# Altium project STM32F411CEU6TR.PrjPcb
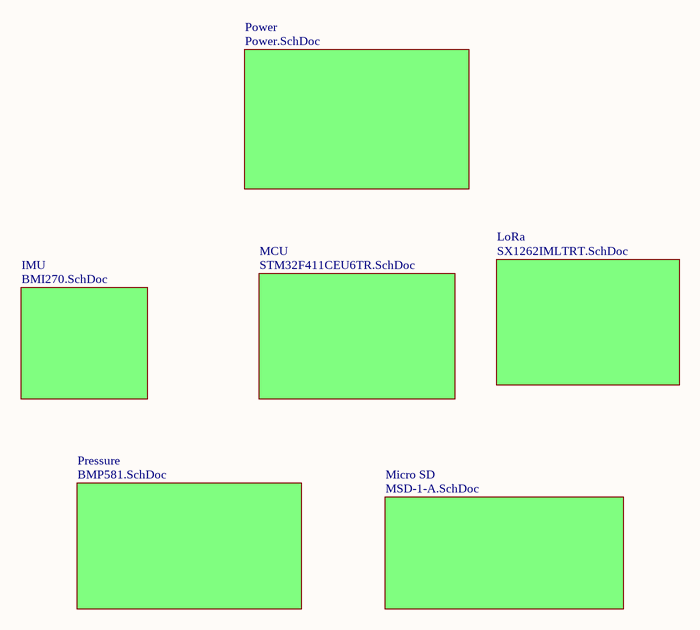
[diagram p0: Main.SchDoc]
7 sheets, 4 parts. Net scope: global (net labels, ports and power ports of the same name join across sheets).
Sheets:
  Main.SchDoc
    MCU = STM32F411CEU6TR.SchDoc
    Pressure = BMP581.SchDoc
    Micro SD = MSD-1-A.SchDoc
    IMU = BMI270.SchDoc
    LoRa = SX1262IMLTRT.SchDoc
    Power = Power.SchDoc

## Sheet Main.SchDoc
size A; SheetNumber: 1; SheetTotal: 7

### Sub-sheets
IMU = BMI270.SchDoc: no entries
LoRa = SX1262IMLTRT.SchDoc: no entries
MCU = STM32F411CEU6TR.SchDoc: no entries
Micro SD = MSD-1-A.SchDoc: no entries
Power = Power.SchDoc: no entries
Pressure = BMP581.SchDoc: no entries

## Sheet STM32F411CEU6TR.SchDoc
size A; SheetNumber: 3; SheetTotal: 7
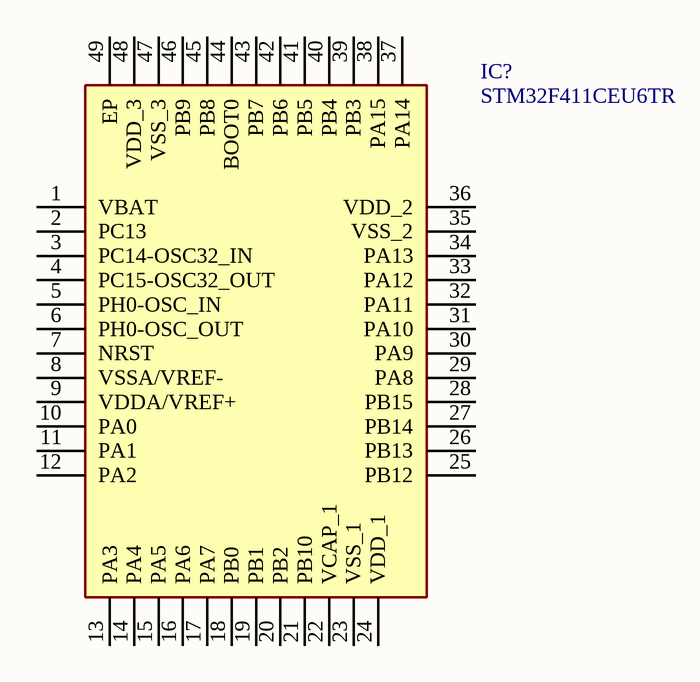
[diagram p1: STM32F411CEU6TR.SchDoc]

### Parts
(Parts that share a designator on the sheet are numbered #1, #2 ... from top to bottom, then left to right.)
IC?#1  STM32F411CEU6TR  [QFN50P700X700X60-49N-D]

### Nets

Not connected (* = marked no-connect by the designer): IC?#1 1(VBAT) 2(PC13) 3(PC14-OSC32_IN) 4(PC15-OSC32_OUT) 5(PH0-OSC_IN) 6(PH0-OSC_OUT) 7(NRST) 8(VSSA/VREF-) 9(VDDA/VREF+) 10(PA0) 11(PA1) 12(PA2) 13(PA3) 14(PA4) 15(PA5) 16(PA6) 17(PA7) 18(PB0) 19(PB1) 20(PB2) 21(PB10) 22(VCAP_1) 23(VSS_1) 24(VDD_1) 25(PB12) 26(PB13) 27(PB14) 28(PB15) 29(PA8) 30(PA9) 31(PA10) 32(PA11) 33(PA12) 34(PA13) 35(VSS_2) 36(VDD_2) 37(PA14) 38(PA15) 39(PB3) 40(PB4) 41(PB5) 42(PB6) 43(PB7) 44(BOOT0) 45(PB8) 46(PB9) 47(VSS_3) 48(VDD_3) 49(EP)

### Library data of the parts
IC?#1 = STM32F411CEU6TR: Integrated Circuit; Manufacturer_Name: STMicroelectronics; Datasheet Link: https://www.st.com/resource/en/datasheet/stm32f411ce.pdf; Height: 0.6mm; Manufacturer_Part_Number: STM32F411CEU6TR; Mouser Part Number: 511-STM32F411CEU6TR; Mouser Price/Stock: https://www.mouser.co.uk/ProductDetail/STMicroelectronics/STM32F411CEU6TR?qs=qzCNEk%252BRr%252BZBKltb1HJU1w%3D%3D; Arrow Part Number: STM32F411CEU6TR; Arrow Price/Stock: https://www.arrow.com/en/products/stm32f411ceu6tr/stmicroelectronics.html?utm_currency=USD&region=nac

## Sheet BMP581.SchDoc
size A; SheetNumber: 4; SheetTotal: 4

## Sheet MSD-1-A.SchDoc
size A; SheetNumber: 5; SheetTotal: 6
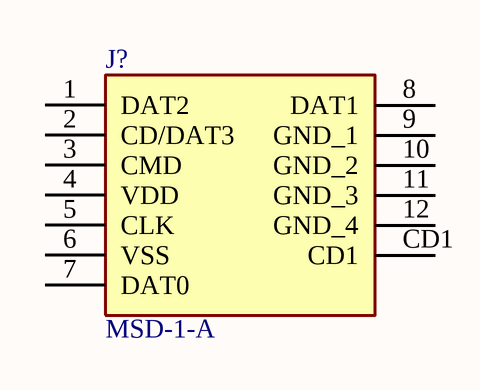
[diagram p2: MSD-1-A.SchDoc]

### Parts
J?  MSD-1-A  [MSD1A]

### Nets

Not connected (* = marked no-connect by the designer): J? 1(DAT2) 2(CD/DAT3) 3(CMD) 4(VDD) 5(CLK) 6(VSS) 7(DAT0) 8(DAT1) 9(GND_1) 10(GND_2) 11(GND_3) 12(GND_4) CD1

### Library data of the parts
J? = MSD-1-A: Connector; Manufacturer_Name: Same Sky; Datasheet Link: https://www.sameskydevices.com/product/resource/msd-1-a.pdf; Height: 2mm; Manufacturer_Part_Number: MSD-1-A; Mouser Part Number: 179-MSD-1-A; Mouser Price/Stock: https://www.mouser.co.uk/ProductDetail/Same-Sky/MSD-1-A?qs=Z%252BL2brAPG1Ip18XLC4tUPQ%3D%3D; Arrow Part Number: MSD-1-A; Arrow Price/Stock: https://www.arrow.com/en/products/msd-1-a/cui-devices?utm_currency=USD&region=nac

## Sheet BMI270.SchDoc
size A; SheetNumber: 2; SheetTotal: 6
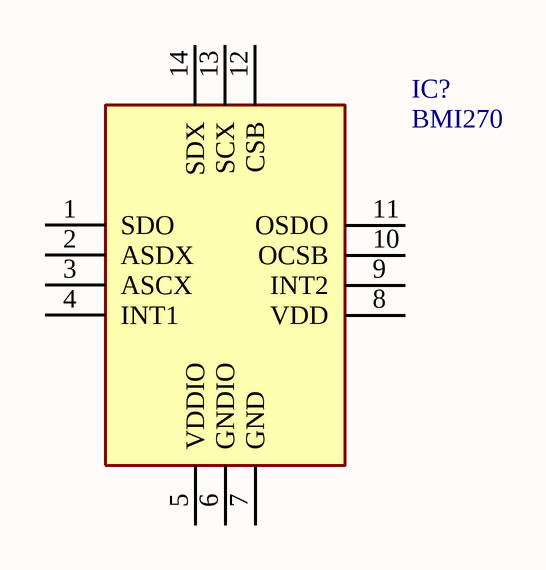
[diagram p3: BMI270.SchDoc]

### Parts
(Parts that share a designator on the sheet are numbered #1, #2 ... from top to bottom, then left to right.)
IC?#2  BMI270  [BMI270]

### Nets

Not connected (* = marked no-connect by the designer): IC?#2 1(SDO) 2(ASDX) 3(ASCX) 4(INT1) 5(VDDIO) 6(GNDIO) 7(GND) 8(VDD) 9(INT2) 10(OCSB) 11(OSDO) 12(CSB) 13(SCX) 14(SDX)

### Library data of the parts
IC?#2 = BMI270: Integrated Circuit; Manufacturer_Name: BOSCH; Datasheet Link: https://www.bosch-sensortec.com/media/boschsensortec/downloads/datasheets/bst-bmi270-ds000.pdf; Height: 0.87mm; Manufacturer_Part_Number: BMI270; Mouser Part Number: 262-BMI270; Mouser Price/Stock: https://www.mouser.co.uk/ProductDetail/Bosch-Sensortec/BMI270?qs=u16ybLDytRYIj%252BjQEee88A%3D%3D; Arrow Part Number: BMI270; Arrow Price/Stock: https://www.arrow.com/en/products/bmi270/bosch-sensortec?utm_currency=USD&region=europe

## Sheet SX1262IMLTRT.SchDoc
size A; SheetNumber: 6; SheetTotal: 6
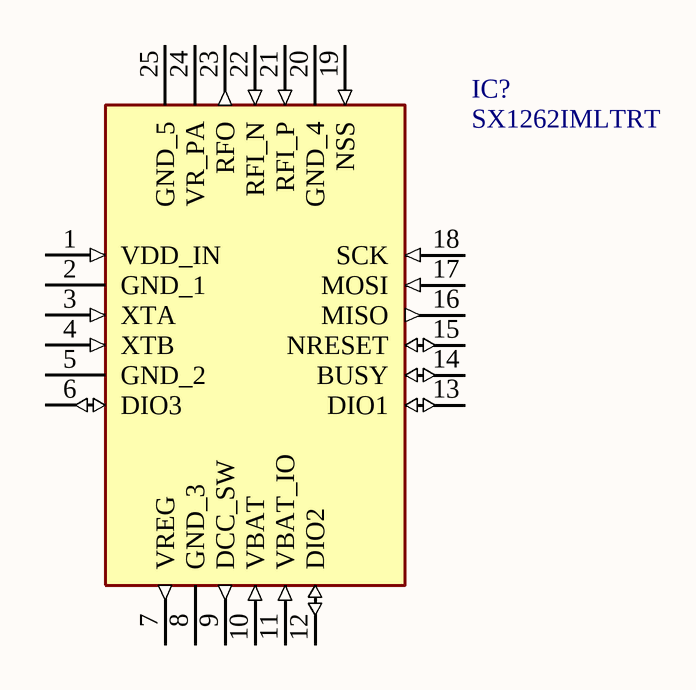
[diagram p4: SX1262IMLTRT.SchDoc]

### Parts
(Parts that share a designator on the sheet are numbered #1, #2 ... from top to bottom, then left to right.)
IC?#3  SX1262IMLTRT  [QFN50P400X400X100-25N-D]

### Nets

Not connected (* = marked no-connect by the designer): IC?#3 1(VDD_IN) 2(GND_1) 3(XTA) 4(XTB) 5(GND_2) 6(DIO3) 7(VREG) 8(GND_3) 9(DCC_SW) 10(VBAT) 11(VBAT_IO) 12(DIO2) 13(DIO1) 14(BUSY) 15(NRESET) 16(MISO) 17(MOSI) 18(SCK) 19(NSS) 20(GND_4) 21(RFI_P) 22(RFI_N) 23(RFO) 24(VR_PA) 25(GND_5)

### Library data of the parts
IC?#3 = SX1262IMLTRT: Integrated Circuit; Manufacturer_Name: SEMTECH; Datasheet Link: http://www.mouser.com/datasheet/2/761/DS_SX1261-2_V1.1-1307803.pdf; Height: 1mm; Manufacturer_Part_Number: SX1262IMLTRT; Mouser Part Number: 947-SX1262IMLTRT; Mouser Price/Stock: https://www.mouser.co.uk/ProductDetail/Semtech/SX1262IMLTRT?qs=XFmntM7Yc9eYt6yxTPughQ%3D%3D; Arrow Part Number: SX1262IMLTRT; Arrow Price/Stock: https://www.arrow.com/en/products/sx1262imltrt/semtech.html?utm_currency=USD&region=nac

## Sheet Power.SchDoc
size A; SheetNumber: 7; SheetTotal: 7